# Altium schematic sheet ESD_Mainboard_Overview.SchDoc
size A4; SheetNumber: 1; SheetTotal: 2
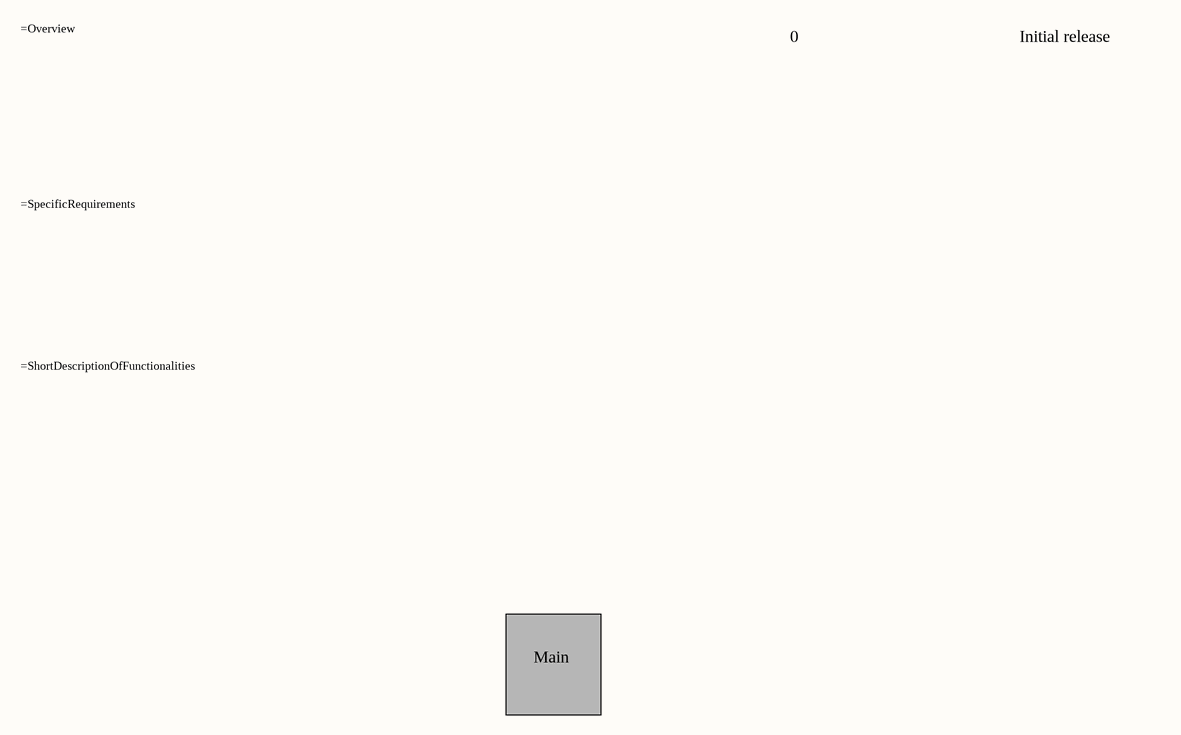
[diagram p0: ESD_Mainboard_Overview.SchDoc]

## Sub-sheets
U_Main = Main.SchDoc: no entries

## Notes on the sheet
- 0
- Initial release
- Main
- Project description
- Revision table
- Overview
- REV
- Release date
- Description
- Specific requirements
- Short description of functionalities
- Variant description
- Schematic
- Design Engineer
- No.
- Info
- This document and the information it
- contains, including the principles of
- design are the proprietary confidential
- property of MC Electronics.
- Maciej Czerwiński Electronics
- NIP: PL1251711124
- Konopnickiej 16A
- 05-250 Radzymin
- biuro@mcelectronics.biz
- Approval Engineer
- This information is submitted to you
- with the agreement that it is not to be
- disclosed to third parties without prior
- written consent from MC Electronics.
- Acceptance of this document constitutes
- Title:
- greement to these restrictions.
- Date:
- Project ID
- Sheet:
- of
- Module ID -
- Revision
- -
- Size A4